# Altium schematic sheet CS301_YOURGROUPNUM.SchDoc
size A3; SheetNumber: 1; SheetTotal: 1
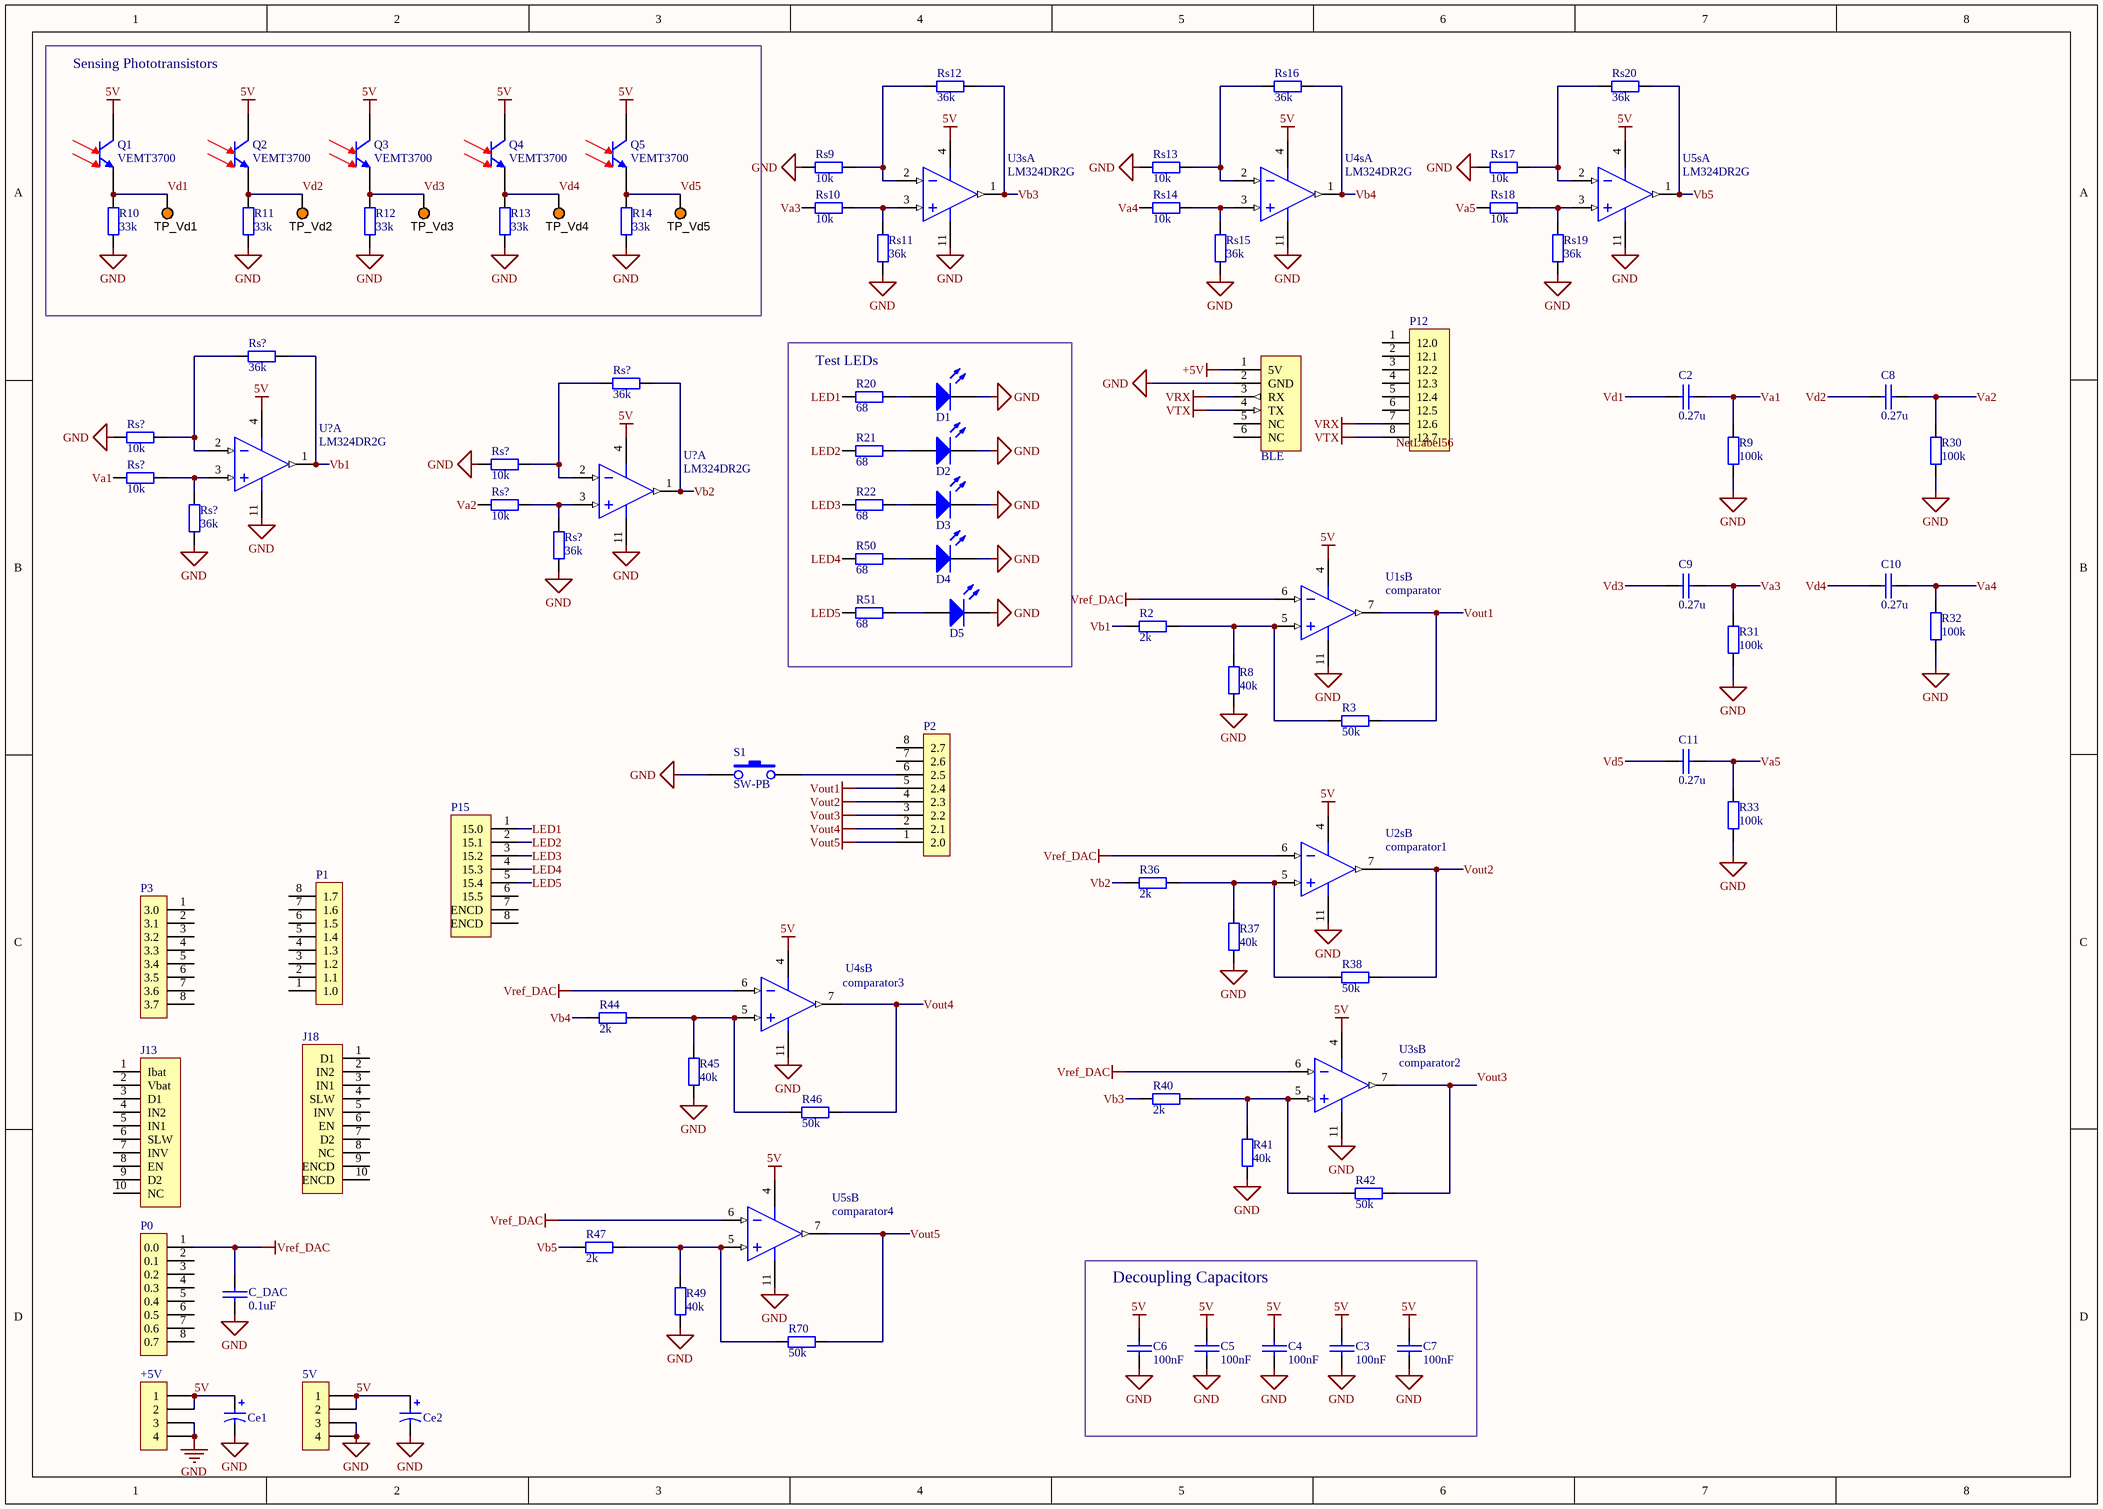
[diagram p0: CS301_YOURGROUPNUM.SchDoc]

## Parts
(Parts that share a designator on the sheet are numbered #1, #2 ... from top to bottom, then left to right.)
5V  5V  [IDC4]  (value not drawn)
+5V  5V  [IDC4]  (value not drawn)
BLE  BLE Module Header  [HM10_HDR1X6]  (value not drawn)
C2  0.27u  [0805 CAP]
C3  100nF  [0805 CAP]
C4  100nF  [0805 CAP]
C5  100nF  [0805 CAP]
C6  100nF  [0805 CAP]
C7  100nF  [0805 CAP]
C8  0.27u  [0805 CAP]
C9  0.27u  [0805 CAP]
C10  0.27u  [0805 CAP]
C11  0.27u  [0805 CAP]
C_DAC  0.1uF  [0805 CAP]
Ce1  100uF  [CAP POL 8x5.4mm SMT]  (value not drawn)
Ce2  100uF  [CAP POL 8x5.4mm SMT]  (value not drawn)
D1  LTST-C170KGKT  [0805 LED]  (value not drawn)
D2  LTST-C170KGKT  [0805 LED]  (value not drawn)
D3  LTST-C170KGKT  [0805 LED]  (value not drawn)
D4  LTST-C170KGKT  [0805 LED]  (value not drawn)
D5  LTST-C170KGKT  [0805 LED]  (value not drawn)
J13  CON10  [idc10]  (value not drawn)
J18  CON10  [IDC10]  (value not drawn)
P0  P0  [idc8]  (value not drawn)
P1  P1  [idc8]  (value not drawn)
P2  P2  [idc8]  (value not drawn)
P3  P3  [idc8]  (value not drawn)
P12  P12  [idc8]  (value not drawn)
P15  P15  [idc8]  (value not drawn)
Q1  VEMT3700  [VEMT3700]
Q2  VEMT3700  [VEMT3700]
Q3  VEMT3700  [VEMT3700]
Q4  VEMT3700  [VEMT3700]
Q5  VEMT3700  [VEMT3700]
R2  2k  [0805 RES]
R3  50k  [0805 RES]
R8  40k  [0805 RES]
R9  100k  [0805 RES]
R10  33k  [0805 RES]
R11  33k  [0805 RES]
R12  33k  [0805 RES]
R13  33k  [0805 RES]
R14  33k  [0805 RES]
R20  68  [0805 RES]
R21  68  [0805 RES]
R22  68  [0805 RES]
R30  100k  [0805 RES]
R31  100k  [0805 RES]
R32  100k  [0805 RES]
R33  100k  [0805 RES]
R36  2k  [0805 RES]
R37  40k  [0805 RES]
R38  50k  [0805 RES]
R40  2k  [0805 RES]
R41  40k  [0805 RES]
R42  50k  [0805 RES]
R44  2k  [0805 RES]
R45  40k  [0805 RES]
R46  50k  [0805 RES]
R47  2k  [0805 RES]
R49  40k  [0805 RES]
R50  68  [0805 RES]
R51  68  [0805 RES]
R70  50k  [0805 RES]
Rs9  10k  [0805 RES]
Rs10  10k  [0805 RES]
Rs11  36k  [0805 RES]
Rs12  36k  [0805 RES]
Rs13  10k  [0805 RES]
Rs14  10k  [0805 RES]
Rs15  36k  [0805 RES]
Rs16  36k  [0805 RES]
Rs17  10k  [0805 RES]
Rs18  10k  [0805 RES]
Rs19  36k  [0805 RES]
Rs20  36k  [0805 RES]
Rs?#1  36k  [0805 RES]
Rs?#2  36k  [0805 RES]
Rs?#3  10k  [0805 RES]
Rs?#4  10k  [0805 RES]
Rs?#5  10k  [0805 RES]
Rs?#6  10k  [0805 RES]
Rs?#7  36k  [0805 RES]
Rs?#8  36k  [0805 RES]
S1  SW-PB  [SW-PB]
TP_Vd1  5003  [TP_TH]  (value not drawn)
TP_Vd2  5003  [TP_TH]  (value not drawn)
TP_Vd3  5003  [TP_TH]  (value not drawn)
TP_Vd4  5003  [TP_TH]  (value not drawn)
TP_Vd5  5003  [TP_TH]  (value not drawn)
U1s  comparator  [SOIC-14]  (part B of 4)
U2s  comparator1  [SOIC-14]  (part B of 4)
U3s  LM324DR2G  [SOIC-14]  (parts A,B of 4)
U4s  LM324DR2G  [SOIC-14]  (parts A,B of 4)
U5s  LM324DR2G  [SOIC-14]  (parts A,B of 4)
U?#1  LM324DR2G  [SOIC-14]  (part A of 4)
U?#2  LM324DR2G  [SOIC-14]  (part A of 4)

## Blocks framed on the sheet
Sensing Phototransistors: Q1-Q5 R10-R14 TP_Vd1-TP_Vd5
Test LEDs: D1-D5 R20-R22 R50 R51
Decoupling Capacitors: C3-C7

## Nets
5V: 5V.1 5V.2 +5V.1 +5V.2 C3.1 C4.1 C5.1 C6.1 C7.1 Ce1.1 Ce2.1 Q1.1(C) Q2.1(C) Q3.1(C) Q4.1(C) Q5.1(C) U1s.4(VCC) U2s.4(VCC) U3s.4(VCC) U4s.4(VCC) U5s.4(VCC) U?#1.4(VCC) U?#2.4(VCC)
+5V: BLE.1(5V)
GND: 5V.3 5V.4 +5V.3 +5V.4 BLE.2(GND) C3.2 C4.2 C5.2 C6.2 C7.2 C_DAC.2 Ce1.2 Ce2.2 D1.2(K) D2.2(K) D3.2(K) D4.2(K) D5.2(K) R8.2 R9.1 R10.1 R11.1 R12.1 R13.1 R14.1 R30.1 R31.1 R32.1 R33.1 R37.2 R41.2 R45.2 R49.2 Rs9.1 Rs11.1 Rs13.1 Rs15.1 Rs17.1 Rs19.1 Rs?#3.1 Rs?#4.1 Rs?#7.1 Rs?#8.1 S1.1 U1s.11(VEE/GND) U2s.11(VEE/GND) U3s.11(VEE/GND) U4s.11(VEE/GND) U5s.11(VEE/GND) U?#1.11(VEE/GND) U?#2.11(VEE/GND)
Vout1: P2.5(2.4) R3.1 U1s.7(OUT2)
Vout2: P2.4(2.3) R38.1 U2s.7(OUT2)
Vout3: P2.3(2.2) R42.1 U3s.7(OUT2)
Vout4: P2.2(2.1) R46.1 U4s.7(OUT2)
Vout5: P2.1(2.0) R70.1 U5s.7(OUT2)
Vref_DAC: C_DAC.1 P0.1(0.0) U1s.6(IN2-) U2s.6(IN2-) U3s.6(IN2-) U4s.6(IN2-) U5s.6(IN2-)
VRX: BLE.3(RX) P12.7(12.6)
VTX: BLE.4(TX) P12.8(12.7)
LED1: P15.1(15.0) R20.1
LED2: P15.2(15.1) R21.1
LED3: P15.3(15.2) R22.1
LED4: P15.4(15.3) R50.1
LED5: P15.5(15.4) R51.1
Va1: C2.2 R9.2 Rs?#5.1
Va2: C8.2 R30.2 Rs?#6.1
Va3: C9.2 R31.2 Rs10.1
Va4: C10.2 R32.2 Rs14.1
Va5: C11.2 R33.2 Rs18.1
Vb1: R2.1 Rs?#1.2 U?#1.1(OUT1)
Vb2: R36.1 Rs?#2.2 U?#2.1(OUT1)
Vb3: R40.1 Rs12.2 U3s.1(OUT1)
Vb4: R44.1 Rs16.2 U4s.1(OUT1)
Vb5: R47.1 Rs20.2 U5s.1(OUT1)
Vd1: C2.1 Q1.2(E) R10.2 TP_Vd1.1
Vd2: C8.1 Q2.2(E) R11.2 TP_Vd2.1
Vd3: C9.1 Q3.2(E) R12.2 TP_Vd3.1
Vd4: C10.1 Q4.2(E) R13.2 TP_Vd4.1
Vd5: C11.1 Q5.2(E) R14.2 TP_Vd5.1
NetD1_1: D1.1(A) R20.2
NetD2_1: D2.1(A) R21.2
NetD3_1: D3.1(A) R22.2
NetD4_1: D4.1(A) R50.2
NetD5_1: D5.1(A) R51.2
NetP2_6: P2.6(2.5) S1.2
NetR2_2: R2.2 R3.2 R8.1 U1s.5(IN2+)
NetR36_2: R36.2 R37.1 R38.2 U2s.5(IN2+)
NetR40_2: R40.2 R41.1 R42.2 U3s.5(IN2+)
NetR44_2: R44.2 R45.1 R46.2 U4s.5(IN2+)
NetR47_2: R47.2 R49.1 R70.2 U5s.5(IN2+)
NetRs9_2: Rs9.2 Rs12.1 U3s.2(IN1-)
NetRs10_2: Rs10.2 Rs11.2 U3s.3(IN1+)
NetRs13_2: Rs13.2 Rs16.1 U4s.2(IN1-)
NetRs14_2: Rs14.2 Rs15.2 U4s.3(IN1+)
NetRs17_2: Rs17.2 Rs20.1 U5s.2(IN1-)
NetRs18_2: Rs18.2 Rs19.2 U5s.3(IN1+)
NetRs?#1_1: Rs?#1.1 Rs?#3.2 U?#1.2(IN1-)
NetRs?#2_1: Rs?#2.1 Rs?#4.2 U?#2.2(IN1-)
NetRs?#5_2: Rs?#5.2 Rs?#7.2 U?#1.3(IN1+)
NetRs?#6_2: Rs?#6.2 Rs?#8.2 U?#2.3(IN1+)

Not connected (* = marked no-connect by the designer): BLE 5(NC) 6(NC); J13 1(Ibat) 2(Vbat) 3(D1) 4(IN2) 5(IN1) 6(SLW) 7(INV) 8(EN) 9(D2) 10(NC); J18 1(D1) 2(IN2) 3(IN1) 4(SLW) 5(INV) 6(EN) 7(D2) 8(NC) 9(ENCD) 10(ENCD); P0 2(0.1) 3(0.2) 4(0.3) 5(0.4) 6(0.5) 7(0.6) 8(0.7); P1 1(1.0) 2(1.1) 3(1.2) 4(1.3) 5(1.4) 6(1.5) 7(1.6) 8(1.7); P2 7(2.6) 8(2.7); P3 1(3.0) 2(3.1) 3(3.2) 4(3.3) 5(3.4) 6(3.5) 7(3.6) 8(3.7); P12 1(12.0) 2(12.1) 3(12.2) 4(12.3) 5(12.4) 6(12.5); P15 6(15.5) 7(ENCD) 8(ENCD)

## Notes on the sheet
- Labels drawn without touching a wire or pin: NetLabel56

## Library data of the parts
5V +5V = CON4: Connector
BLE = BLEModule_TH: 2.54mm pitch 6-pin header for BLE module; LatestRevisionDate: 17-Jul-2002; LatestRevisionNote: Re-released for DXP Platform.; Publisher: Altium Limited
C2-C11 C_DAC = CerCap_SMT_0805: SMT ceramic capacitor 0805 size; Value: *
Ce1 Ce2 = ElecCap_SMT_8D0: CAP ALUM 22UF 20% 50V SMD (Model: UWX1H220MCL1GB); Manufacturer: Nichicon; Manufacturer Part Number: UWX1V220MCL1GB; Lifetime @ Temp.: 2000 Hrs @ 85°C; Polarization: Polar; Surface Mount Land Size: 0.260" L x 0.260" W (6.60mm x 6.60mm); Capacitance 1: 22 µF; Revision: July-2002: Re-released for DXP Platform.; RoHS: RoHS Compliant; Category: Capacitors; Stock 1: 680; Pricing 1: 1=0.59, 10=0.406, 100=0.2304, 500=0.16268 (NZD); Packaging: Cut Tape (CT); Part Status: Active; Tolerance: ±20%; ESR (Equivalent Series Resistance): -; Operating Temperature: -40°C ~ 85°C; Ratings: -; Applications: General Purpose; Lead Spacing: -; Size / Dimension: 0.248" Dia (6.30mm); Height - Seated (Max): 0.213" (5.40mm); Mounting Type: Surface Mount; Package / Case: Radial, Can - SMD; ComponentLink1URL: http://nichicon-us.com/english/products/pdfs/e-uwx.pdf; ComponentLink1Description: http://nichicon-us.com/english/products/pdfs/e-uwx.pdf; Supplier 1: Digi-Key; Supplier Part Number 1: 493-2136-1-ND; Value: *
D1-D5 = LED_SMT_0805: SMT LED 0805 size; Manufacturer: Lite-On Inc.; Color: Green; Lens Color: Colorless; Lens Transparency: Clear; Millicandela Rating: 35mcd; Lens Style/Size: Rectangle with Flat Top, 1.40mm x 1.25mm; Voltage - Forward (Vf) (Typ): 2V; Current - Test: 20mA; Viewing Angle: 130°; Wavelength - Dominant: 571nm; Wavelength - Peak: 574nm; Supplier 1: Digi-Key; Manufacturer Part Number: LTST-C170KGKT; RoHS: RoHS Compliant; Category: Optoelectronics; Stock 1: 503069; Pricing 1: 1=0.62, 10=0.459, 25=0.338, 100=0.2415, 250=0.16416, 500=0.14486, 1000=0.11347 (NZD); Packaging: Cut Tape (CT); Part Status: Active; Mounting Type: Surface Mount; Features: -; Package / Case: 0805 (2012 Metric); Size / Dimension: 2.00mm L x 1.25mm W; Height (Max): 1.10mm; ComponentLink1URL: http://optoelectronics.liteon.com/upload/download/DS22-2000-073/LTST-C170KGKT.pdf; ComponentLink1Description: http://optoelectronics.liteon.com/upload/download/DS22-2000-073/LTST-C170KGKT.pdf; Supplier Part Number 1: 160-1414-1-ND
J13 J18 = CON10: Connector
P0-P3 = CON8: Connector
P12 P15 = CON8_1: Connector
Q1-Q5 = VEMT3700: Silicon NPN Phototransistor
R2 R3 R8-R14 R20-R22 R30-R33 R36-R38 R40-R42 R44-R47 R49-R51 R70 Rs9-Rs20 Rs?#1-Rs?#8 = Res_SMT_0805: 0805 resistor; Published: 8-Jun-2000; LatestRevisionDate: 17-Jul-2002; LatestRevisionNote: Re-released for DXP Platform.; PackageReference: AXIAL-0.4; Publisher: Altium Limited; Value: *; ComponentLink1Description: https://nz.mouser.com/datasheet/2/315/AOA0000C304-1149620.pdf
S1 = SW-PB: Push Button Switch
TP_Vd1-TP_Vd5 = TestPoint: Test Point, Orange, 1-Pin THD, RoHS; Peak Reverse Current: 600 uA; Forward Current: 3 A; Max Surge Current: 80 A; Forward Voltage: 1.08 V; Max Operating Temperature: 150 degC; PackageReference: 5003; Pins: 2; ComponentLink2URL: http://keyelco.com/userAssets/file/M65p56.pdf; PackageDescription: 1-Pin Through Hole Device, Dia 2.54 mm; Weight: 0.01 lb; Diameter: 5.3 mm; Mount: Through Hole; Package Quantity: 500; Packaging: Bulk; Min Operating Temperature: -65 degC; ComponentLink1Description: Manufacturer URL; Height: 0.25 inch; ComponentLink1URL: http://www.keyelco.com/; ComponentLink2Description: Datasheet; Width: 0.25 inch; REACH SVHC: No SVHC; RoHSCompliant: true; Radiation Hardening: No; Length: 9.5 mm; DatasheetVersion: Jun-15
U1s U2s = LM324DR_SMT_SOIC16: Single Supply Quad Operational Amplifier, 3 to 32 V, 0 to 70 degC, 14-Pin SOIC, Pb-Free, Tape and Reel; Manufacturer: On Semiconductor; PartNumber: LM324DR2G; VCC Max (V): 32; VCC Min (V): 3; PackageVersion: Rev. K, 05/2011; ComponentLink3URL: http://www.onsemi.com/pub_link/Collateral/751A-03.PDF; ComponentLink3Description: Package Specification; Packing: Tape and Reel; ComponentLink2URL: http://www.onsemi.cn/pub_link/Collateral/LM324-D.PDF; PackageReference: SOIC-14-751A-03; ComponentLink1URL: http://www.onsemi.com/; PackageDescription: 14-Pin Small Outline Integrated Circuit, Body 8.65 x 3.9 mm, Pitch 1.27 mm; ComponentLink1Description: Manufacturer URL; DatasheetVersion: Rev. 25; Mounting Technology: Surface Mount; RoHS: TRUE; ComponentLink2Description: Datasheet
U3s U4s U5s U?#1 U?#2 = LM324DR_SMT_SOIC16: Single Supply Quad Operational Amplifier, 3 to 32 V, 0 to 70 degC, 14-Pin SOIC, Pb-Free, Tape and Reel; Manufacturer: On Semiconductor; VCC Max (V): 32; VCC Min (V): 3; PackageVersion: Rev. K, 05/2011; ComponentLink3URL: http://www.onsemi.com/pub_link/Collateral/751A-03.PDF; ComponentLink3Description: Package Specification; Packing: Tape and Reel; ComponentLink2URL: http://www.onsemi.cn/pub_link/Collateral/LM324-D.PDF; PackageReference: SOIC-14-751A-03; ComponentLink1URL: http://www.onsemi.com/; PackageDescription: 14-Pin Small Outline Integrated Circuit, Body 8.65 x 3.9 mm, Pitch 1.27 mm; ComponentLink1Description: Manufacturer URL; DatasheetVersion: Rev. 25; Mounting Technology: Surface Mount; RoHS: TRUE; ComponentLink2Description: Datasheet; PartNumber: LM324DR2G